# Altium schematic sheet BatterySentinel-N2K-Orion-R5-Power.SchDoc
size A2
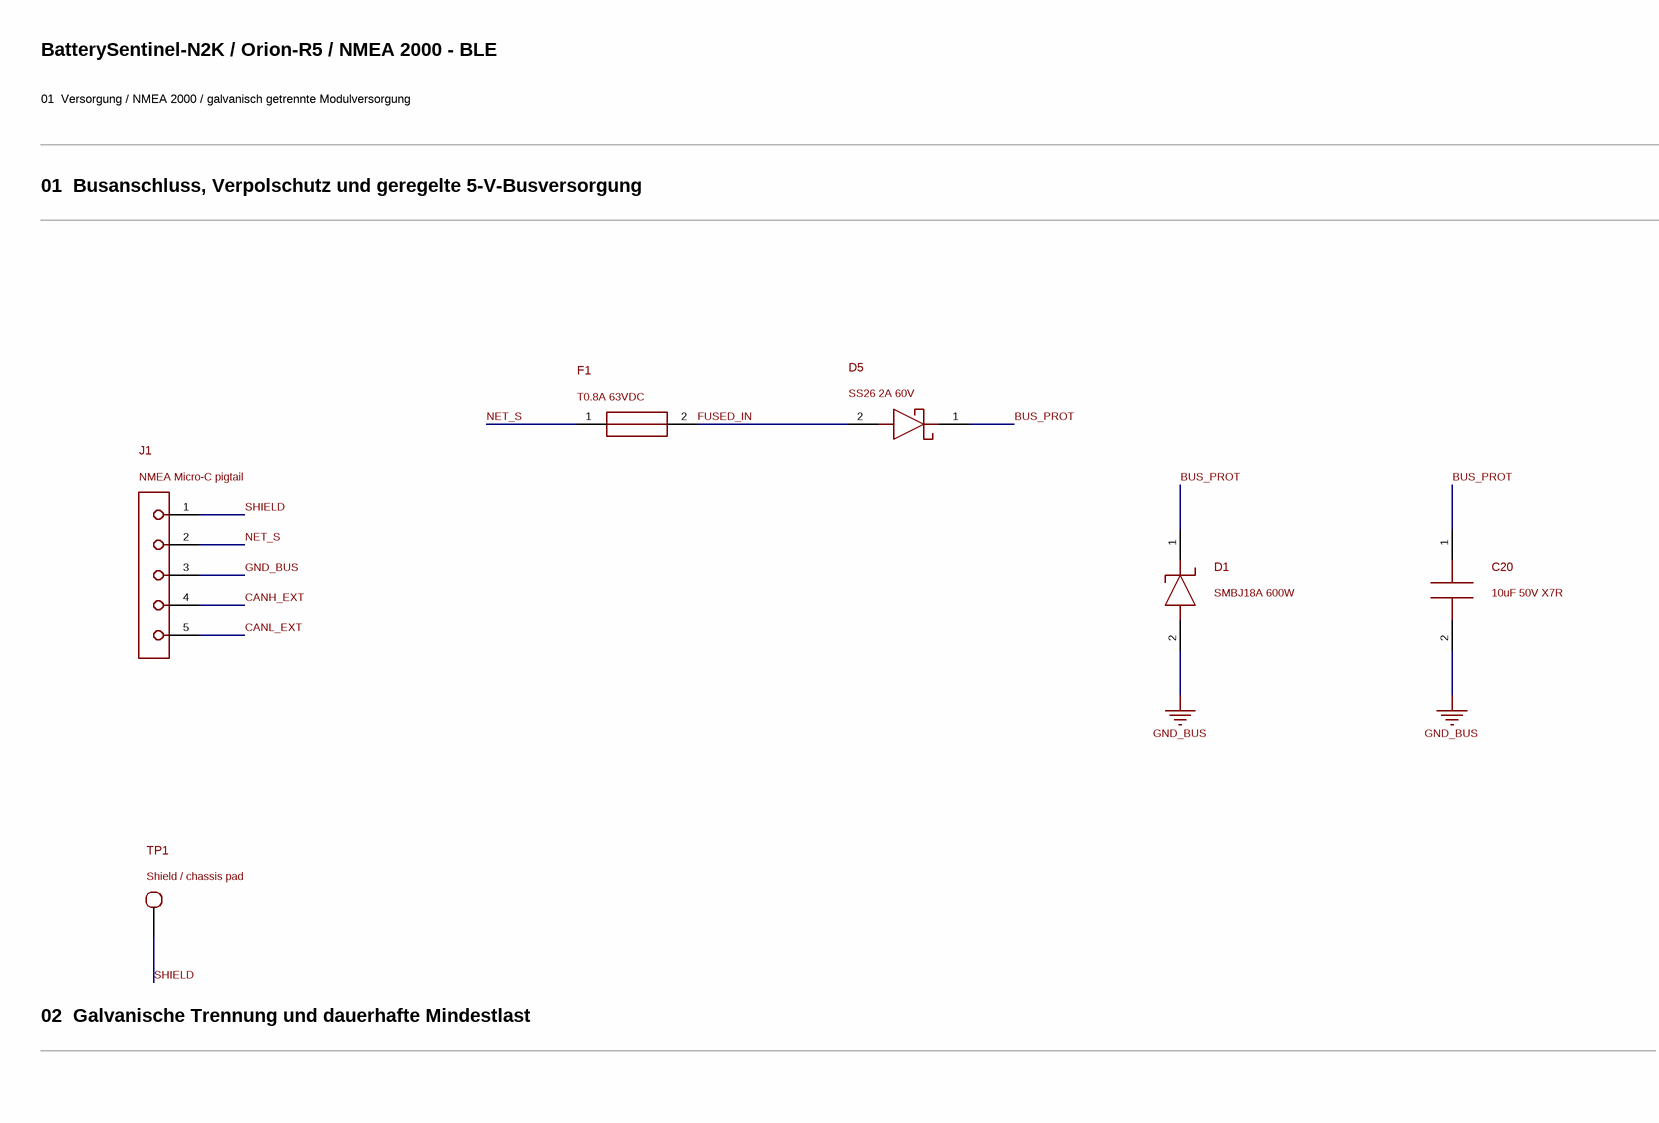
[diagram p0: BatterySentinel-N2K-Orion-R5-Power.SchDoc, top left]
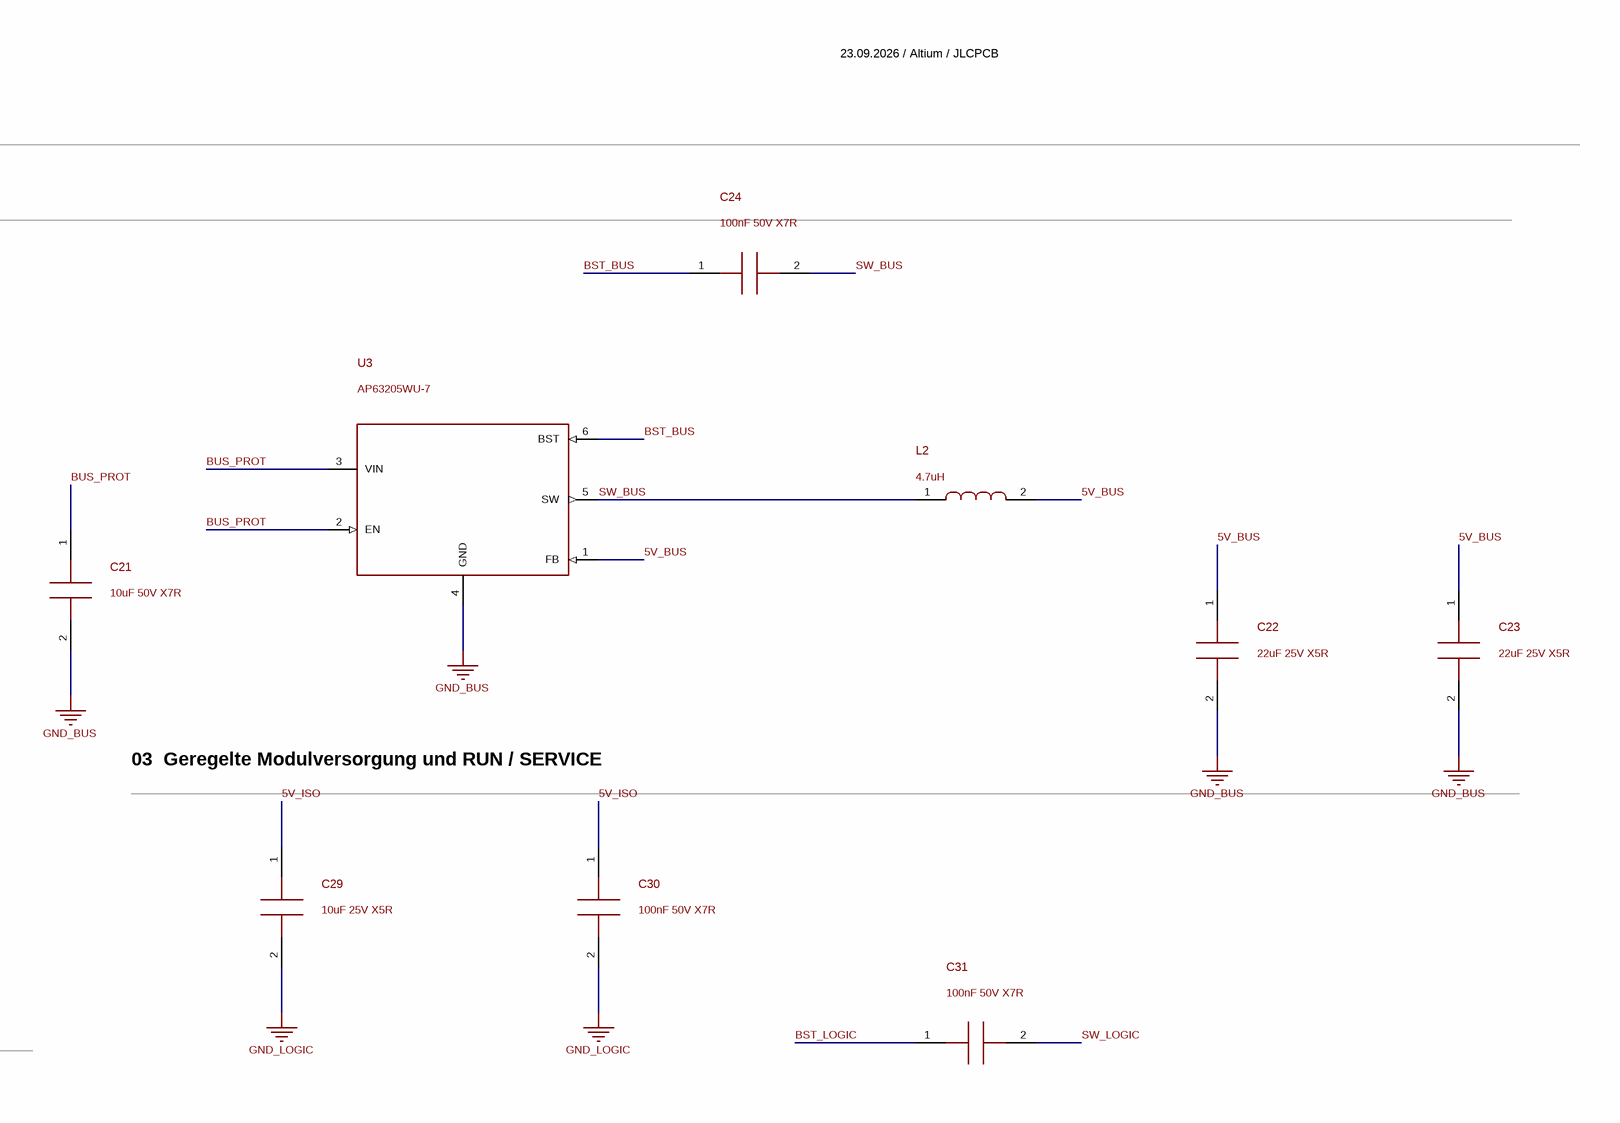
[diagram p1: BatterySentinel-N2K-Orion-R5-Power.SchDoc, top right]
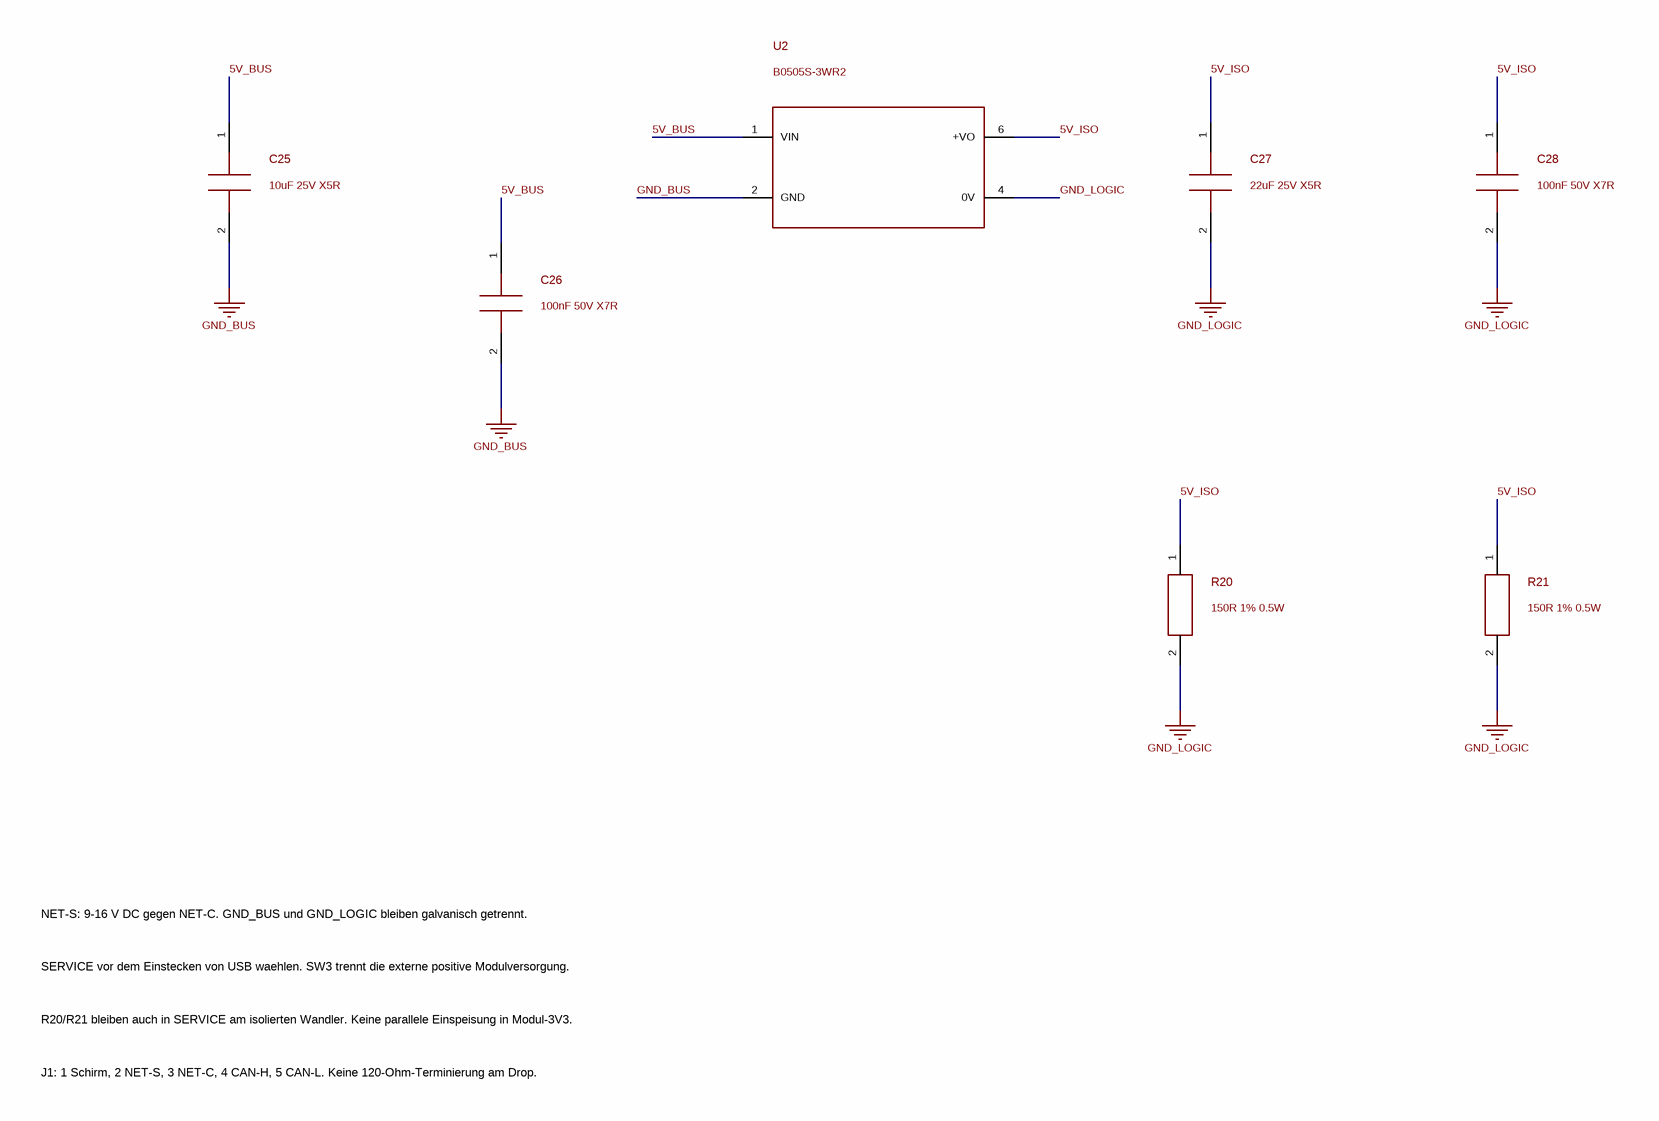
[diagram p2: BatterySentinel-N2K-Orion-R5-Power.SchDoc, bottom left]
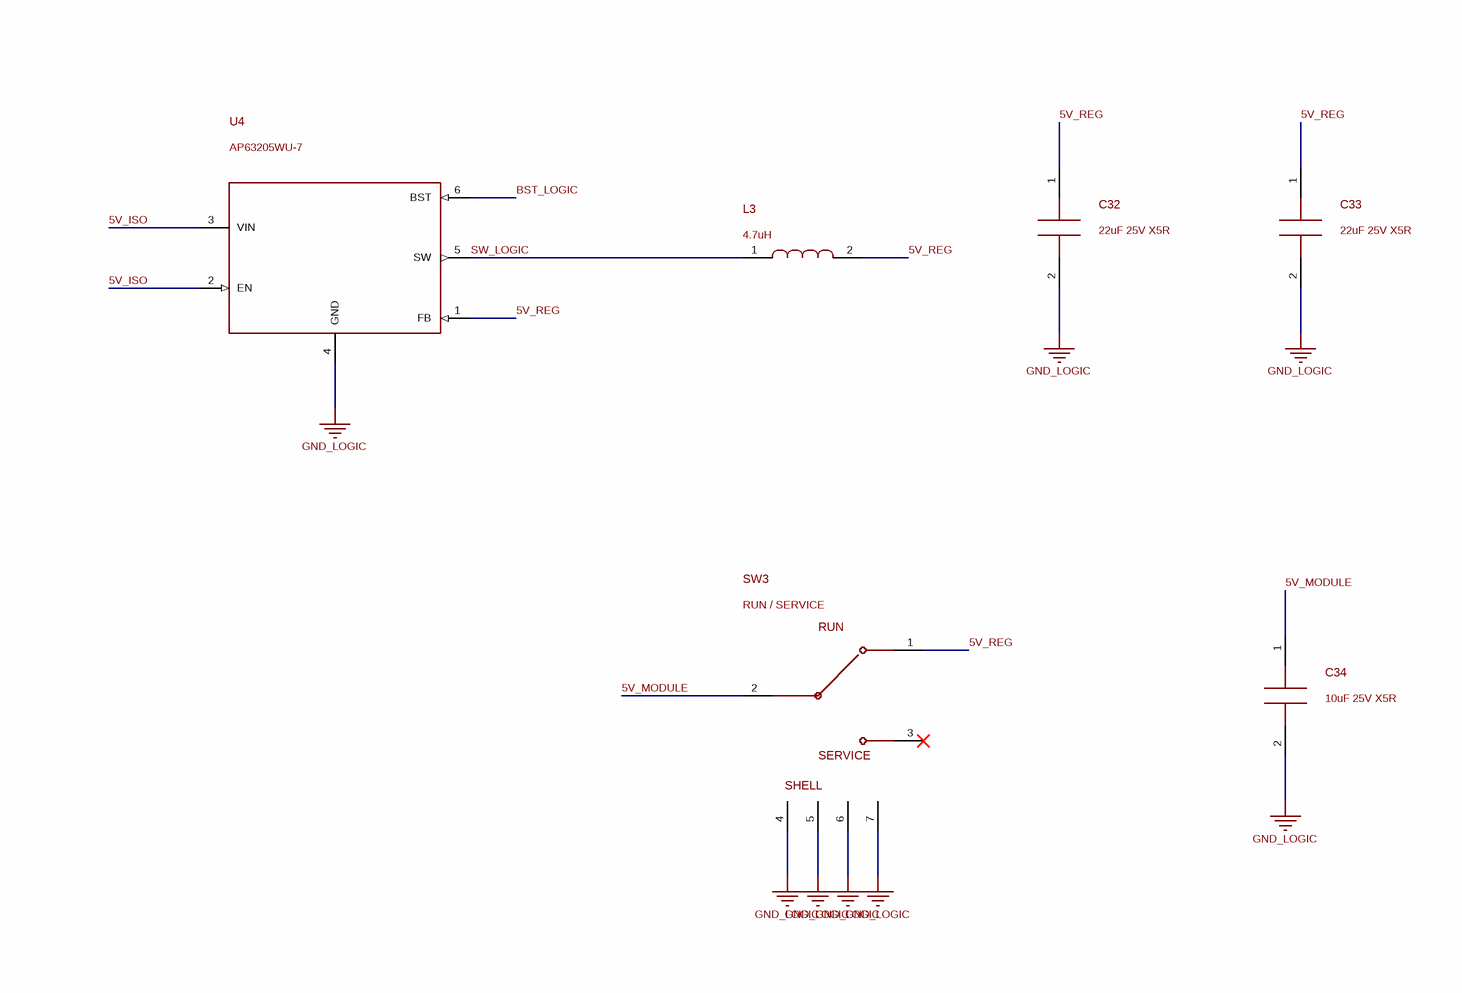
[diagram p3: BatterySentinel-N2K-Orion-R5-Power.SchDoc, bottom right]

## Parts
C20  10uF 50V X7R  [C1210]
C21  10uF 50V X7R  [C1210]
C22  22uF 25V X5R  [C1206]
C23  22uF 25V X5R  [C1206]
C24  100nF 50V X7R  [C0603]
C25  10uF 25V X5R  [C0805]
C26  100nF 50V X7R  [C0603]
C27  22uF 25V X5R  [C1206]
C28  100nF 50V X7R  [C0603]
C29  10uF 25V X5R  [C0805]
C30  100nF 50V X7R  [C0603]
C31  100nF 50V X7R  [C0603]
C32  22uF 25V X5R  [C1206]
C33  22uF 25V X5R  [C1206]
C34  10uF 25V X5R  [C0805]
D1  SMBJ18A 600W  [SMB]
D5  SS26 2A 60V  [SMA]
F1  T0.8A 63VDC  [BOURNS_SF1206S]
J1  NMEA Micro-C pigtail  [PIGTAIL_5_P3_D1P3]
L2  4.7uH  [SUNLORD_SWPA4030]
L3  4.7uH  [SUNLORD_SWPA4030]
R20  150R 1% 0.5W  [R1206]
R21  150R 1% 0.5W  [R1206]
SW3  RUN / SERVICE  [GSWITCH_MK12C02_G020]
TP1  Shield / chassis pad  [TESTPOINT_2MM]
U2  B0505S-3WR2  [EVISUN_B0505S_3WR2]
U3  AP63205WU-7  [TSOT26_DIODES]
U4  AP63205WU-7  [TSOT26_DIODES]

## Nets
GND_BUS: C20.2 C21.2 C22.2 C23.2 C25.2 C26.2 D1.2(A) J1.3(NET-C) U2.2(GND) U3.4(GND)
GND_LOGIC: C27.2 C28.2 C29.2 C30.2 C32.2 C33.2 C34.2 R20.2 R21.2 SW3.4(SHIELD1) SW3.5(SHIELD2) SW3.6(SHIELD3) SW3.7(SHIELD4) U2.4(0V) U4.4(GND)
5V_BUS: C22.1 C23.1 C25.1 C26.1 L2.2 U2.1(VIN) U3.1(FB)
5V_ISO: C27.1 C28.1 C29.1 C30.1 R20.1 R21.1 U2.6(+VO) U4.2(EN) U4.3(VIN)
5V_MODULE: C34.1 SW3.2(COMMON)
5V_REG: C32.1 C33.1 L3.2 SW3.1(RUN_IN) U4.1(FB)
BST_BUS: C24.1 U3.6(BST)
BST_LOGIC: C31.1 U4.6(BST)
BUS_PROT: C20.1 C21.1 D1.1(K) D5.1(K) U3.2(EN) U3.3(VIN)
CANH_EXT: J1.4(CAN-H)
CANL_EXT: J1.5(CAN-L)
FUSED_IN: D5.2(A) F1.2
NET_S: F1.1 J1.2(NET-S)
SHIELD: J1.1(SHIELD) TP1.1(SHIELD)
SW_BUS: C24.2 L2.1 U3.5(SW)
SW_LOGIC: C31.2 L3.1 U4.5(SW)

Not connected (* = marked no-connect by the designer): SW3 3(SERVICE_NC)*

## Notes on the sheet
- BatterySentinel-N2K / Orion-R5 / NMEA 2000 - BLE
- 23.09.2026 / Altium / JLCPCB
- 01  Versorgung / NMEA 2000 / galvanisch getrennte Modulversorgung
- 01  Busanschluss, Verpolschutz und geregelte 5-V-Busversorgung
- 03  Geregelte Modulversorgung und RUN / SERVICE
- 02  Galvanische Trennung und dauerhafte Mindestlast
- NET-S: 9-16 V DC gegen NET-C. GND_BUS und GND_LOGIC bleiben galvanisch getrennt.
- SERVICE vor dem Einstecken von USB waehlen. SW3 trennt die externe positive Modulversorgung.
- R20/R21 bleiben auch in SERVICE am isolierten Wandler. Keine parallele Einspeisung in Modul-3V3.
- J1: 1 Schirm, 2 NET-S, 3 NET-C, 4 CAN-H, 5 CAN-L. Keine 120-Ohm-Terminierung am Drop.
- (in symbol R5_SW3_RUN) RUN; SERVICE; SHELL

## Library data of the parts
C20 = R5_C20_10uF: Manufacturer: Samsung Electro-Mechanics; MPN: CL32B106KBJNNNE; ReviewStatus: R5 placement with enclosure interface; Manufacturer Part Number: CL32B106KBJNNNE; Description: 10uF 50V X7R; Datasheet: https://datasheet.lcsc.com/lcsc/1912112237_Samsung-Electro-Mechanics-CL32B106KBJNNNE_C138687.pdf; Supplier 1: LCSC; Supplier Part Number 1: C138687; Footprint Status: R5 placement with enclosure interface
C21 = R5_C21_10uF: Manufacturer: Samsung Electro-Mechanics; MPN: CL32B106KBJNNNE; ReviewStatus: R5 placement with enclosure interface; Manufacturer Part Number: CL32B106KBJNNNE; Description: 10uF 50V X7R; Datasheet: https://datasheet.lcsc.com/lcsc/1912112237_Samsung-Electro-Mechanics-CL32B106KBJNNNE_C138687.pdf; Supplier 1: LCSC; Supplier Part Number 1: C138687; Footprint Status: R5 placement with enclosure interface
C22 = R5_C22_22uF: Manufacturer: Samsung Electro-Mechanics; MPN: CL31A226KAHNNNE; ReviewStatus: R5 placement with enclosure interface; Manufacturer Part Number: CL31A226KAHNNNE; Description: 22uF 25V X5R; Datasheet: https://www.lcsc.com/datasheet/lcsc_datasheet_2304140030_Samsung-Electro-Mechanics-CL31A226KAHNNNE_C12891.pdf; Supplier 1: LCSC; Supplier Part Number 1: C12891; Footprint Status: R5 placement with enclosure interface
C23 = R5_C23_22uF: Manufacturer: Samsung Electro-Mechanics; MPN: CL31A226KAHNNNE; ReviewStatus: R5 placement with enclosure interface; Manufacturer Part Number: CL31A226KAHNNNE; Description: 22uF 25V X5R; Datasheet: https://www.lcsc.com/datasheet/lcsc_datasheet_2304140030_Samsung-Electro-Mechanics-CL31A226KAHNNNE_C12891.pdf; Supplier 1: LCSC; Supplier Part Number 1: C12891; Footprint Status: R5 placement with enclosure interface
C24 = R5_C24_100nF: Manufacturer: YAGEO; MPN: CC0603KRX7R9BB104; ReviewStatus: R5 placement with enclosure interface; Manufacturer Part Number: CC0603KRX7R9BB104; Description: 100nF 50V X7R; Datasheet: https://www.lcsc.com/datasheet/lcsc_datasheet_2211101700_YAGEO-CC0603KRX7R9BB104_C14663.pdf; Supplier 1: LCSC; Supplier Part Number 1: C14663; Footprint Status: R5 placement with enclosure interface
C25 = R5_C25_10uF: Manufacturer: Samsung Electro-Mechanics; MPN: CL21A106KAYNNNE; ReviewStatus: R5 placement with enclosure interface; Manufacturer Part Number: CL21A106KAYNNNE; Description: 10uF 25V X5R; Datasheet: https://www.lcsc.com/datasheet/lcsc_datasheet_2304140030_Samsung-Electro-Mechanics-CL21A106KAYNNNE_C15850.pdf; Supplier 1: LCSC; Supplier Part Number 1: C15850; Footprint Status: R5 placement with enclosure interface
C26 = R5_C26_100nF: Manufacturer: YAGEO; MPN: CC0603KRX7R9BB104; ReviewStatus: R5 placement with enclosure interface; Manufacturer Part Number: CC0603KRX7R9BB104; Description: 100nF 50V X7R; Datasheet: https://www.lcsc.com/datasheet/lcsc_datasheet_2211101700_YAGEO-CC0603KRX7R9BB104_C14663.pdf; Supplier 1: LCSC; Supplier Part Number 1: C14663; Footprint Status: R5 placement with enclosure interface
C27 = R5_C27_22uF: Manufacturer: Samsung Electro-Mechanics; MPN: CL31A226KAHNNNE; ReviewStatus: R5 placement with enclosure interface; Manufacturer Part Number: CL31A226KAHNNNE; Description: 22uF 25V X5R; Datasheet: https://www.lcsc.com/datasheet/lcsc_datasheet_2304140030_Samsung-Electro-Mechanics-CL31A226KAHNNNE_C12891.pdf; Supplier 1: LCSC; Supplier Part Number 1: C12891; Footprint Status: R5 placement with enclosure interface
C28 = R5_C28_100nF: Manufacturer: YAGEO; MPN: CC0603KRX7R9BB104; ReviewStatus: R5 placement with enclosure interface; Manufacturer Part Number: CC0603KRX7R9BB104; Description: 100nF 50V X7R; Datasheet: https://www.lcsc.com/datasheet/lcsc_datasheet_2211101700_YAGEO-CC0603KRX7R9BB104_C14663.pdf; Supplier 1: LCSC; Supplier Part Number 1: C14663; Footprint Status: R5 placement with enclosure interface
C29 = R5_C29_10uF: Manufacturer: Samsung Electro-Mechanics; MPN: CL21A106KAYNNNE; ReviewStatus: R5 placement with enclosure interface; Manufacturer Part Number: CL21A106KAYNNNE; Description: 10uF 25V X5R; Datasheet: https://www.lcsc.com/datasheet/lcsc_datasheet_2304140030_Samsung-Electro-Mechanics-CL21A106KAYNNNE_C15850.pdf; Supplier 1: LCSC; Supplier Part Number 1: C15850; Footprint Status: R5 placement with enclosure interface
C30 = R5_C30_100nF: Manufacturer: YAGEO; MPN: CC0603KRX7R9BB104; ReviewStatus: R5 placement with enclosure interface; Manufacturer Part Number: CC0603KRX7R9BB104; Description: 100nF 50V X7R; Datasheet: https://www.lcsc.com/datasheet/lcsc_datasheet_2211101700_YAGEO-CC0603KRX7R9BB104_C14663.pdf; Supplier 1: LCSC; Supplier Part Number 1: C14663; Footprint Status: R5 placement with enclosure interface
C31 = R5_C31_100nF: Manufacturer: YAGEO; MPN: CC0603KRX7R9BB104; ReviewStatus: R5 placement with enclosure interface; Manufacturer Part Number: CC0603KRX7R9BB104; Description: 100nF 50V X7R; Datasheet: https://www.lcsc.com/datasheet/lcsc_datasheet_2211101700_YAGEO-CC0603KRX7R9BB104_C14663.pdf; Supplier 1: LCSC; Supplier Part Number 1: C14663; Footprint Status: R5 placement with enclosure interface
C32 = R5_C32_22uF: Manufacturer: Samsung Electro-Mechanics; MPN: CL31A226KAHNNNE; ReviewStatus: R5 placement with enclosure interface; Manufacturer Part Number: CL31A226KAHNNNE; Description: 22uF 25V X5R; Datasheet: https://www.lcsc.com/datasheet/lcsc_datasheet_2304140030_Samsung-Electro-Mechanics-CL31A226KAHNNNE_C12891.pdf; Supplier 1: LCSC; Supplier Part Number 1: C12891; Footprint Status: R5 placement with enclosure interface
C33 = R5_C33_22uF: Manufacturer: Samsung Electro-Mechanics; MPN: CL31A226KAHNNNE; ReviewStatus: R5 placement with enclosure interface; Manufacturer Part Number: CL31A226KAHNNNE; Description: 22uF 25V X5R; Datasheet: https://www.lcsc.com/datasheet/lcsc_datasheet_2304140030_Samsung-Electro-Mechanics-CL31A226KAHNNNE_C12891.pdf; Supplier 1: LCSC; Supplier Part Number 1: C12891; Footprint Status: R5 placement with enclosure interface
C34 = R5_C34_10uF: 10uF local module5V reservoir after RUN/SERVICE switch; Manufacturer: Samsung Electro-Mechanics; MPN: CL21A106KAYNNNE; ReviewStatus: R5 placement with enclosure interface; Manufacturer Part Number: CL21A106KAYNNNE; Datasheet: https://www.lcsc.com/datasheet/lcsc_datasheet_2304140030_Samsung-Electro-Mechanics-CL21A106KAYNNNE_C15850.pdf; Supplier 1: LCSC; Supplier Part Number 1: C15850; Footprint Status: R5 placement with enclosure interface
D1 = R5_D1_SMBJ18A: Manufacturer: BORN; ReviewStatus: R5 placement with enclosure interface; MPN: SMBJ18A; Manufacturer Part Number: SMBJ18A; Description: SMBJ18A 600W; Datasheet: https://www.lcsc.com/datasheet/lcsc_datasheet_2304140030_BORN-SMBJ18A_C152104.pdf; Supplier 1: LCSC; Supplier Part Number 1: C152104; Footprint Status: R5 placement with enclosure interface
D5 = R5_D5_SS26: Manufacturer: MDD(Microdiode Semiconductor); ReviewStatus: R5 placement with enclosure interface; MPN: SS26; Manufacturer Part Number: SS26; Description: SS26 2A 60V; Datasheet: https://www.lcsc.com/datasheet/lcsc_datasheet_2407101107_MDD-Microdiode-Semiconductor-SS26_C14238.pdf; Supplier 1: LCSC; Supplier Part Number 1: C14238; Footprint Status: R5 placement with enclosure interface
F1 = R5_F1_T0.8A: 0.8 A slow-blow SMD ceramic fuse, 63 VDC, 50 A interrupt rating; Manufacturer: BOURNS; MPN: SF-1206S080-2; ReviewStatus: R5 placement with enclosure interface; Manufacturer Part Number: SF-1206S080-2; Datasheet: https://wmsc.lcsc.com/wmsc/upload/file/pdf/v2/lcsc/2304140030_BOURNS-SF-1206S080-2_C3032873.pdf; Supplier 1: LCSC; Supplier Part Number 1: C3032873; Footprint Status: R5 placement with enclosure interface
J1 = R5_J1_NMEA: Five direct wire-solder pads for a separately selected Micro-C cable; this is a PCB interface, not an invented connector MPN or face view; ReviewStatus: R5 placement with enclosure interface; Footprint Status: R5 placement with enclosure interface
L2 = R5_L2_4.7uH: Manufacturer: Sunlord; MPN: SWPA4030S4R7MT; ReviewStatus: R5 placement with enclosure interface; Manufacturer Part Number: SWPA4030S4R7MT; Description: 4.7uH; Datasheet: https://www.lcsc.com/datasheet/lcsc_datasheet_2310251551_Sunlord-SWPA4030S4R7MT_C57269.pdf; Supplier 1: LCSC; Supplier Part Number 1: C57269; Footprint Status: R5 placement with enclosure interface
L3 = R5_L3_4.7uH: Manufacturer: Sunlord; MPN: SWPA4030S4R7MT; ReviewStatus: R5 placement with enclosure interface; Manufacturer Part Number: SWPA4030S4R7MT; Description: 4.7uH; Datasheet: https://www.lcsc.com/datasheet/lcsc_datasheet_2310251551_Sunlord-SWPA4030S4R7MT_C57269.pdf; Supplier 1: LCSC; Supplier Part Number 1: C57269; Footprint Status: R5 placement with enclosure interface
R20 = R5_R20_150R: Manufacturer: SEI(Stackpole Elec); MPN: RNCP1206FTD150R; ReviewStatus: R5 placement with enclosure interface; Manufacturer Part Number: RNCP1206FTD150R; Description: 150R 1% 0.5W; Datasheet: https://wmsc.lcsc.com/wmsc/upload/file/pdf/v2/lcsc/2404111532_SEI-Stackpole-Elec-RNCP1206FTD150R_C4258541.pdf; Supplier 1: LCSC; Supplier Part Number 1: C4258541; Footprint Status: R5 placement with enclosure interface
R21 = R5_R21_150R: Manufacturer: SEI(Stackpole Elec); MPN: RNCP1206FTD150R; ReviewStatus: R5 placement with enclosure interface; Manufacturer Part Number: RNCP1206FTD150R; Description: 150R 1% 0.5W; Datasheet: https://wmsc.lcsc.com/wmsc/upload/file/pdf/v2/lcsc/2404111532_SEI-Stackpole-Elec-RNCP1206FTD150R_C4258541.pdf; Supplier 1: LCSC; Supplier Part Number 1: C4258541; Footprint Status: R5 placement with enclosure interface
SW3 = R5_SW3_RUN: Side-actuated SPDT service supply disconnect, 1A at6V, original SuperMini USB service; Manufacturer: G-Switch; MPN: MK-12C02-G020; ReviewStatus: R5 placement with enclosure interface; Manufacturer Part Number: MK-12C02-G020; Datasheet: https://static.chipdip.ru/lib/011/DOC043011829.pdf; Supplier 1: LCSC; Supplier Part Number 1: C963206; Footprint Status: R5 placement with enclosure interface
TP1 = R5_TP1_Shield: Shield / chassis pad - generic specification; manufacturer/MPN not selected; ReviewStatus: R5 placement with enclosure interface; Footprint Status: R5 placement with enclosure interface
U2 = R5_U2_B0505S_3WR2: Manufacturer: EVISUN; ReviewStatus: R5 placement with enclosure interface; MPN: B0505S-3WR2; Manufacturer Part Number: B0505S-3WR2; Description: B0505S-3WR2; Datasheet: https://wmsc.lcsc.com/wmsc/upload/file/pdf/v2/lcsc/2308311627_EVISUN-B0505S-3WR2_C7500927.pdf; Supplier 1: LCSC; Supplier Part Number 1: C7500927; Footprint Status: R5 placement with enclosure interface
U3 = R5_U3_AP63205WU_7: Manufacturer: Diodes Incorporated; ReviewStatus: R5 placement with enclosure interface; MPN: AP63205WU-7; Manufacturer Part Number: AP63205WU-7; Description: AP63205WU-7; Datasheet: https://www.lcsc.com/datasheet/lcsc_datasheet_2210280930_Diodes-Incorporated-AP63205WU-7_C2071056.pdf; Supplier 1: LCSC; Supplier Part Number 1: C2071056; Footprint Status: R5 placement with enclosure interface
U4 = R5_U4_AP63205WU_7: Isolated-side 5V buck / high-duty pass-through, feeding physical RUN/SERVICE disconnect; Manufacturer: Diodes Incorporated; ReviewStatus: R5 placement with enclosure interface; MPN: AP63205WU-7; Manufacturer Part Number: AP63205WU-7; Datasheet: https://www.lcsc.com/datasheet/lcsc_datasheet_2210280930_Diodes-Incorporated-AP63205WU-7_C2071056.pdf; Supplier 1: LCSC; Supplier Part Number 1: C2071056; Footprint Status: R5 placement with enclosure interface